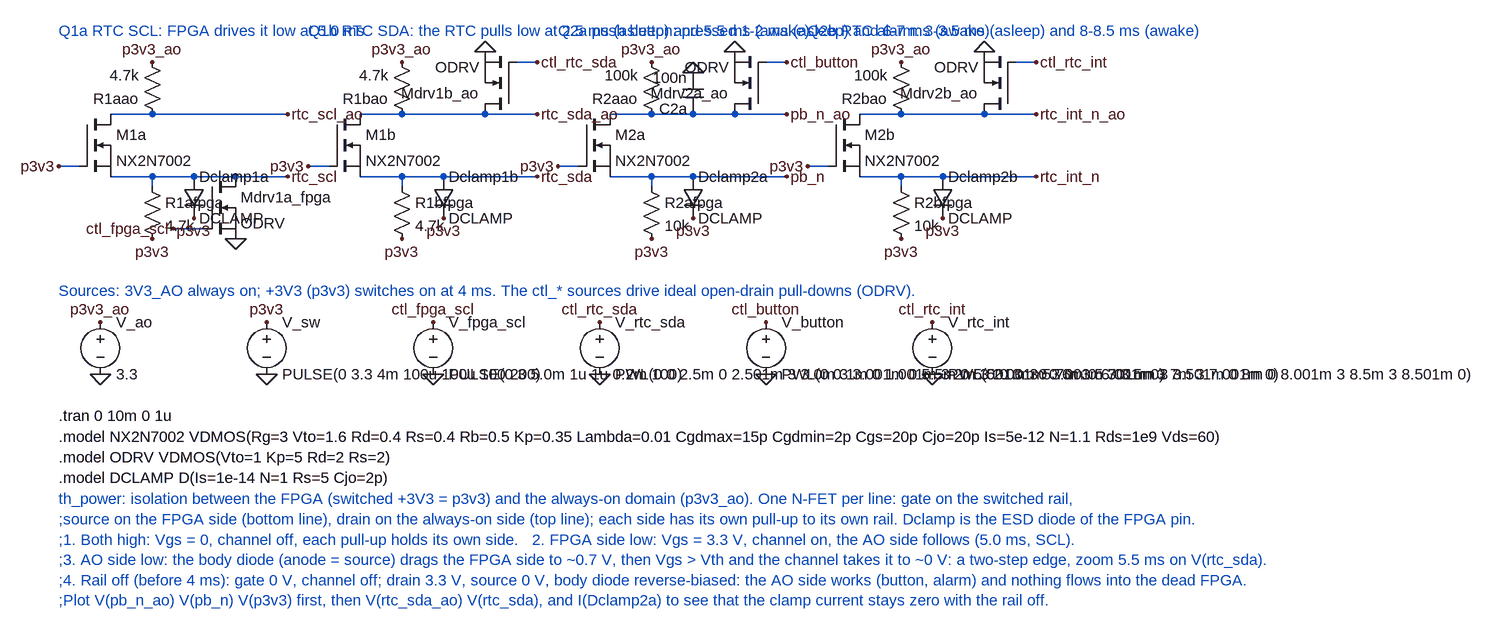
[diagram p0: schematic isolation_fets.asc]
isolation_fets.asc, the LTspice schematic file:
Version 4
SHEET 1 1700 1000
WIRE 144 224 208 224
WIRE 208 224 272 224
WIRE 272 224 336 224
WIRE 336 224 416 224
WIRE 144 320 208 320
WIRE 208 320 272 320
WIRE 272 320 336 320
WIRE 336 320 416 320
WIRE 64 304 96 304
WIRE 208 320 208 336
WIRE 240 400 288 400
WIRE 528 224 592 224
WIRE 592 224 656 224
WIRE 656 224 720 224
WIRE 720 224 800 224
WIRE 528 320 592 320
WIRE 592 320 656 320
WIRE 656 320 720 320
WIRE 720 320 800 320
WIRE 448 304 480 304
WIRE 768 144 800 144
WIRE 592 320 592 336
WIRE 912 224 976 224
WIRE 976 224 1040 224
WIRE 1040 224 1104 224
WIRE 1104 224 1184 224
WIRE 912 320 976 320
WIRE 976 320 1040 320
WIRE 1040 320 1104 320
WIRE 1104 320 1184 320
WIRE 832 304 864 304
WIRE 1152 144 1184 144
WIRE 976 320 976 336
WIRE 1296 224 1360 224
WIRE 1360 224 1424 224
WIRE 1424 224 1488 224
WIRE 1488 224 1568 224
WIRE 1296 320 1360 320
WIRE 1360 320 1424 320
WIRE 1424 320 1488 320
WIRE 1488 320 1568 320
WIRE 1216 304 1248 304
WIRE 1536 144 1568 144
WIRE 1360 320 1360 336
FLAG 416 224 rtc_scl_ao
FLAG 416 320 rtc_scl
FLAG 64 304 p3v3
FLAG 208 144 p3v3_ao
FLAG 208 416 p3v3
FLAG 272 384 p3v3
FLAG 336 416 0
FLAG 240 400 ctl_fpga_scl
FLAG 800 224 rtc_sda_ao
FLAG 800 320 rtc_sda
FLAG 448 304 p3v3
FLAG 592 144 p3v3_ao
FLAG 720 128 0
FLAG 800 144 ctl_rtc_sda
FLAG 592 416 p3v3
FLAG 656 384 p3v3
FLAG 1184 224 pb_n_ao
FLAG 1184 320 pb_n
FLAG 832 304 p3v3
FLAG 976 144 p3v3_ao
FLAG 1040 160 0
FLAG 1104 128 0
FLAG 1184 144 ctl_button
FLAG 976 416 p3v3
FLAG 1040 384 p3v3
FLAG 1568 224 rtc_int_n_ao
FLAG 1568 320 rtc_int_n
FLAG 1216 304 p3v3
FLAG 1360 144 p3v3_ao
FLAG 1488 128 0
FLAG 1568 144 ctl_rtc_int
FLAG 1360 416 p3v3
FLAG 1424 384 p3v3
FLAG 128 544 p3v3_ao
FLAG 128 624 0
FLAG 384 544 p3v3
FLAG 384 624 0
FLAG 640 544 ctl_fpga_scl
FLAG 640 624 0
FLAG 896 544 ctl_rtc_sda
FLAG 896 624 0
FLAG 1152 544 ctl_button
FLAG 1152 624 0
FLAG 1408 544 ctl_rtc_int
FLAG 1408 624 0
SYMBOL nmos 96 224 R0
SYMATTR InstName M1a
SYMATTR Value NX2N7002
SYMBOL res 224 240 R180
SYMATTR InstName R1aao
SYMATTR Value 4.7k
SYMBOL res 192 320 R0
SYMATTR InstName R1afpga
SYMATTR Value 4.7k
SYMBOL diode 256 320 R0
SYMATTR InstName Dclamp1a
SYMATTR Value DCLAMP
SYMBOL nmos 288 320 R0
SYMATTR InstName Mdrv1a_fpga
SYMATTR Value ODRV
SYMBOL nmos 480 224 R0
SYMATTR InstName M1b
SYMATTR Value NX2N7002
SYMBOL res 608 240 R180
SYMATTR InstName R1bao
SYMATTR Value 4.7k
SYMBOL nmos 768 224 R180
SYMATTR InstName Mdrv1b_ao
SYMATTR Value ODRV
SYMBOL res 576 320 R0
SYMATTR InstName R1bfpga
SYMATTR Value 4.7k
SYMBOL diode 640 320 R0
SYMATTR InstName Dclamp1b
SYMATTR Value DCLAMP
SYMBOL nmos 864 224 R0
SYMATTR InstName M2a
SYMATTR Value NX2N7002
SYMBOL res 992 240 R180
SYMATTR InstName R2aao
SYMATTR Value 100k
SYMBOL cap 1056 224 R180
SYMATTR InstName C2a
SYMATTR Value 100n
SYMBOL nmos 1152 224 R180
SYMATTR InstName Mdrv2a_ao
SYMATTR Value ODRV
SYMBOL res 960 320 R0
SYMATTR InstName R2afpga
SYMATTR Value 10k
SYMBOL diode 1024 320 R0
SYMATTR InstName Dclamp2a
SYMATTR Value DCLAMP
SYMBOL nmos 1248 224 R0
SYMATTR InstName M2b
SYMATTR Value NX2N7002
SYMBOL res 1376 240 R180
SYMATTR InstName R2bao
SYMATTR Value 100k
SYMBOL nmos 1536 224 R180
SYMATTR InstName Mdrv2b_ao
SYMATTR Value ODRV
SYMBOL res 1344 320 R0
SYMATTR InstName R2bfpga
SYMATTR Value 10k
SYMBOL diode 1408 320 R0
SYMATTR InstName Dclamp2b
SYMATTR Value DCLAMP
SYMBOL voltage 128 528 R0
SYMATTR InstName V_ao
SYMATTR Value 3.3
SYMBOL voltage 384 528 R0
SYMATTR InstName V_sw
SYMATTR Value PULSE(0 3.3 4m 100u 100u 100 200)
SYMBOL voltage 640 528 R0
SYMATTR InstName V_fpga_scl
SYMATTR Value PULSE(0 3 5.0m 1u 1u 0.2m 100)
SYMBOL voltage 896 528 R0
SYMATTR InstName V_rtc_sda
SYMATTR Value PWL(0 0 2.5m 0 2.501m 3 3.0m 3 3.001m 0 5.5m 0 5.501m 3 5.7m 3 5.701m 0)
SYMBOL voltage 1152 528 R0
SYMATTR InstName V_button
SYMATTR Value PWL(0 0 1m 0 1.001m 3 2m 3 2.001m 0 6m 0 6.001m 3 7m 3 7.001m 0)
SYMBOL voltage 1408 528 R0
SYMATTR InstName V_rtc_int
SYMATTR Value PWL(0 0 3m 0 3.001m 3 3.5m 3 3.501m 0 8m 0 8.001m 3 8.5m 3 8.501m 0)
TEXT 64 96 Left 2 ;Q1a RTC SCL: FPGA drives it low at 5.0 ms
TEXT 448 96 Left 2 ;Q1b RTC SDA: the RTC pulls low at 2.5 ms (asleep) and 5.5 ms (awake)
TEXT 832 96 Left 2 ;Q2a push button: pressed 1-2 ms (asleep) and 6-7 ms (awake)
TEXT 1216 96 Left 2 ;Q2b RTC alarm: 3-3.5 ms (asleep) and 8-8.5 ms (awake)
TEXT 64 496 Left 2 ;Sources: 3V3_AO always on; +3V3 (p3v3) switches on at 4 ms. The ctl_* sources drive ideal open-drain pull-downs (ODRV).
TEXT 64 688 Left 2 !.tran 0 10m 0 1u
TEXT 64 720 Left 2 !.model NX2N7002 VDMOS(Rg=3 Vto=1.6 Rd=0.4 Rs=0.4 Rb=0.5 Kp=0.35 Lambda=0.01 Cgdmax=15p Cgdmin=2p Cgs=20p Cjo=20p Is=5e-12 N=1.1 Rds=1e9 Vds=60)
TEXT 64 752 Left 2 !.model ODRV VDMOS(Vto=1 Kp=5 Rd=2 Rs=2)\n.model DCLAMP D(Is=1e-14 N=1 Rs=5 Cjo=2p)
TEXT 64 816 Left 2 ;th_power: isolation between the FPGA (switched +3V3 = p3v3) and the always-on domain (p3v3_ao). One N-FET per line: gate on the switched rail,\n;source on the FPGA side (bottom line), drain on the always-on side (top line); each side has its own pull-up to its own rail. Dclamp is the ESD diode of the FPGA pin.\n;1. Both high: Vgs = 0, channel off, each pull-up holds its own side.   2. FPGA side low: Vgs = 3.3 V, channel on, the AO side follows (5.0 ms, SCL).\n;3. AO side low: the body diode (anode = source) drags the FPGA side to ~0.7 V, then Vgs > Vth and the channel takes it to ~0 V: a two-step edge, zoom 5.5 ms on V(rtc_sda).\n;4. Rail off (before 4 ms): gate 0 V, channel off; drain 3.3 V, source 0 V, body diode reverse-biased: the AO side works (button, alarm) and nothing flows into the dead FPGA.\n;Plot V(pb_n_ao) V(pb_n) V(p3v3) first, then V(rtc_sda_ao) V(rtc_sda), and I(Dclamp2a) to see that the clamp current stays zero with the rail off.

The netlist it stands for:
* isolation_fets.asc
M1a rtc_scl_ao p3v3 rtc_scl rtc_scl NX2N7002
R1aao rtc_scl_ao p3v3_ao 4.7k
R1afpga rtc_scl p3v3 4.7k
Dclamp1a rtc_scl p3v3 DCLAMP
Mdrv1a_fpga rtc_scl ctl_fpga_scl 0 0 ODRV
M1b rtc_sda_ao p3v3 rtc_sda rtc_sda NX2N7002
R1bao rtc_sda_ao p3v3_ao 4.7k
Mdrv1b_ao rtc_sda_ao ctl_rtc_sda 0 0 ODRV
R1bfpga rtc_sda p3v3 4.7k
Dclamp1b rtc_sda p3v3 DCLAMP
M2a pb_n_ao p3v3 pb_n pb_n NX2N7002
R2aao pb_n_ao p3v3_ao 100k
C2a pb_n_ao 0 100n
Mdrv2a_ao pb_n_ao ctl_button 0 0 ODRV
R2afpga pb_n p3v3 10k
Dclamp2a pb_n p3v3 DCLAMP
M2b rtc_int_n_ao p3v3 rtc_int_n rtc_int_n NX2N7002
R2bao rtc_int_n_ao p3v3_ao 100k
Mdrv2b_ao rtc_int_n_ao ctl_rtc_int 0 0 ODRV
R2bfpga rtc_int_n p3v3 10k
Dclamp2b rtc_int_n p3v3 DCLAMP
V_ao p3v3_ao 0 3.3
V_sw p3v3 0 PULSE(0 3.3 4m 100u 100u 100 200)
V_fpga_scl ctl_fpga_scl 0 PULSE(0 3 5.0m 1u 1u 0.2m 100)
V_rtc_sda ctl_rtc_sda 0 PWL(0 0 2.5m 0 2.501m 3 3.0m 3 3.001m 0 5.5m 0 5.501m 3 5.7m 3 5.701m 0)
V_button ctl_button 0 PWL(0 0 1m 0 1.001m 3 2m 3 2.001m 0 6m 0 6.001m 3 7m 3 7.001m 0)
V_rtc_int ctl_rtc_int 0 PWL(0 0 3m 0 3.001m 3 3.5m 3 3.501m 0 8m 0 8.001m 3 8.5m 3 8.501m 0)
.model D D
.lib standard.dio
.model NMOS NMOS
.model PMOS PMOS
.lib standard.mos
* Q1a RTC SCL: FPGA drives it low at 5.0 ms
* Q1b RTC SDA: the RTC pulls low at 2.5 ms (asleep) and 5.5 ms (awake)
* Q2a push button: pressed 1-2 ms (asleep) and 6-7 ms (awake)
* Q2b RTC alarm: 3-3.5 ms (asleep) and 8-8.5 ms (awake)
* Sources: 3V3_AO always on; +3V3 (p3v3) switches on at 4 ms. The ctl_* sources drive ideal open-drain pull-downs (ODRV).
.tran 0 10m 0 1u
.model NX2N7002 VDMOS(Rg=3 Vto=1.6 Rd=0.4 Rs=0.4 Rb=0.5 Kp=0.35 Lambda=0.01 Cgdmax=15p Cgdmin=2p Cgs=20p Cjo=20p Is=5e-12 N=1.1 Rds=1e9 Vds=60)
.model ODRV VDMOS(Vto=1 Kp=5 Rd=2 Rs=2)
.model DCLAMP D(Is=1e-14 N=1 Rs=5 Cjo=2p)
* th_power: isolation between the FPGA (switched +3V3 = p3v3) and the always-on domain (p3v3_ao). One N-FET per line: gate on the switched rail,
* ;source on the FPGA side (bottom line), drain on the always-on side (top line); each side has its own pull-up to its own rail. Dclamp is the ESD diode of the FPGA pin.
* ;1. Both high: Vgs = 0, channel off, each pull-up holds its own side.   2. FPGA side low: Vgs = 3.3 V, channel on, the AO side follows (5.0 ms, SCL).
* ;3. AO side low: the body diode (anode = source) drags the FPGA side to ~0.7 V, then Vgs > Vth and the channel takes it to ~0 V: a two-step edge, zoom 5.5 ms on V(rtc_sda).
* ;4. Rail off (before 4 ms): gate 0 V, channel off; drain 3.3 V, source 0 V, body diode reverse-biased: the AO side works (button, alarm) and nothing flows into the dead FPGA.
* ;Plot V(pb_n_ao) V(pb_n) V(p3v3) first, then V(rtc_sda_ao) V(rtc_sda), and I(Dclamp2a) to see that the clamp current stays zero with the rail off.
.backanno
.end